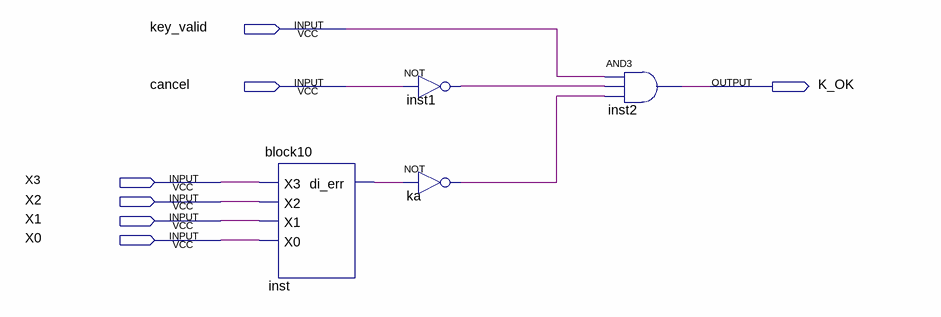
[diagram p0: schematic sheet]
// Quartus schematic block11.bdf as structural Verilog: 4 symbols, 7 pins
module block11 (
  input  key_valid,
  input  cancel,
  input  X3,
  input  X2,
  input  X1,
  input  X0,
  output K_OK
);

  wire inst1_out, inst_di_err, ka_out;

  block10 inst (.X3(X3), .X2(X2), .X1(X1), .X0(X0), .di_err(inst_di_err));
  not inst1 (inst1_out, cancel);
  not ka (ka_out, inst_di_err);
  and inst2 (K_OK, key_valid, inst1_out, ka_out);
endmodule
